# Altium schematic sheet Root.SchDoc
size A; SheetNumber: 1; SheetTotal: 8
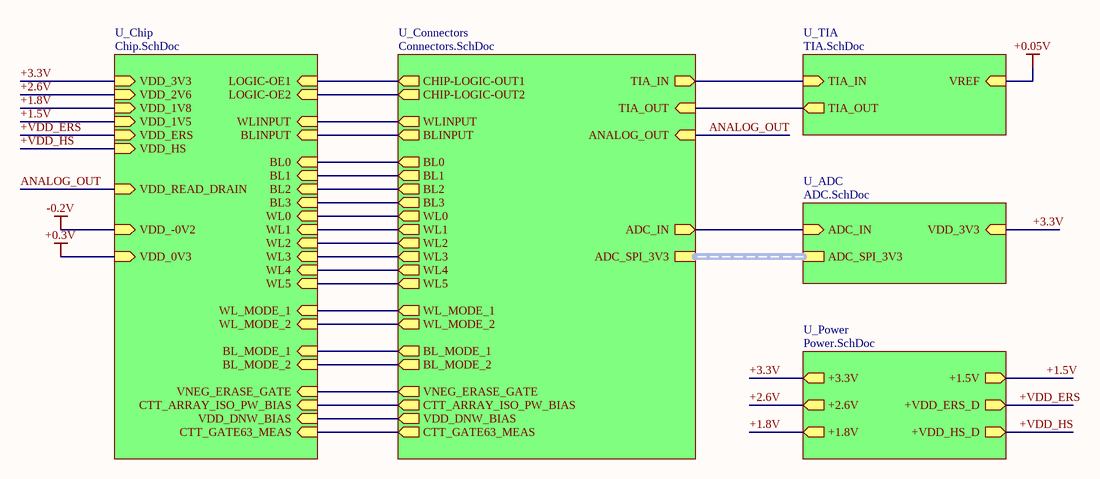
[diagram p0: Root.SchDoc]

## Sub-sheets
U_ADC = ADC.SchDoc: ADC_IN (in), VDD_3V3 (in), ADC_SPI_3V3 (harness ADC_SPI_3V3)
U_Chip = Chip.SchDoc: BL0 (in), BL1 (in), BL2 (in), BL3 (in), WL0 (in), WL1 (in), WL2 (in), WL3 (in), WL4 (in), WL5 (in), BL_MODE_2 (in), BL_MODE_1 (in), WL_MODE_2 (in), WL_MODE_1 (in), WLINPUT (in), BLINPUT (in), LOGIC-OE1 (in), LOGIC-OE2 (in), VDD_HS (in), VDD_ERS (in), VDD_1V5 (in), VDD_1V8 (in), VDD_2V6 (in), VDD_3V3 (in), VNEG_ERASE_GATE (in), CTT_ARRAY_ISO_PW_BIAS (in), CTT_GATE63_MEAS (in), VDD_DNW_BIAS (in), VDD_READ_DRAIN (in), VDD_-0V2 (in), VDD_0V3 (in)
U_Connectors = Connectors.SchDoc: BL0 (out), BL1 (out), WL0 (out), WL1 (out), WL2 (out), WL3 (out), WL4 (out), WL5 (out), BL2 (out), BL3 (out), BL_MODE_2 (out), BL_MODE_1 (out), WL_MODE_2 (out), WL_MODE_1 (out), TIA_IN (out), CHIP-LOGIC-OUT1 (out), CHIP-LOGIC-OUT2 (out), WLINPUT (out), BLINPUT (out), ADC_IN (out), TIA_OUT (in), ANALOG_OUT (in), VNEG_ERASE_GATE (out), CTT_ARRAY_ISO_PW_BIAS (out), CTT_GATE63_MEAS (out), VDD_DNW_BIAS (out), ADC_SPI_3V3 (harness ADC_SPI_3V3)
U_Power = Power.SchDoc: +1.5V (out), +1.8V (out), +2.6V (out), +3.3V (out), +VDD_ERS_D (out), +VDD_HS_D (out)
U_TIA = TIA.SchDoc: TIA_IN (in), VREF (in), TIA_OUT (out)

## Nets
+0.3V: sheet U_Chip/VDD_0V3
+0.05V: sheet U_TIA/VREF
-0.2V: sheet U_Chip/VDD_-0V2
+1.5V: sheet U_Power/+1.5V, sheet U_Chip/VDD_1V5
+1.8V: sheet U_Power/+1.8V, sheet U_Chip/VDD_1V8
+2.6V: sheet U_Power/+2.6V, sheet U_Chip/VDD_2V6
+3.3V: sheet U_ADC/VDD_3V3, sheet U_Power/+3.3V, sheet U_Chip/VDD_3V3
+VDD_ERS: sheet U_Power/+VDD_ERS_D, sheet U_Chip/VDD_ERS
+VDD_HS: sheet U_Power/+VDD_HS_D, sheet U_Chip/VDD_HS
ANALOG_OUT: sheet U_Connectors/ANALOG_OUT, sheet U_Chip/VDD_READ_DRAIN
(unnamed): sheet U_TIA/TIA_IN, sheet U_Connectors/TIA_IN
(unnamed): sheet U_TIA/TIA_OUT, sheet U_Connectors/TIA_OUT
(unnamed): sheet U_Connectors/BL0, sheet U_Chip/BL0
(unnamed): sheet U_Connectors/BL1, sheet U_Chip/BL1
(unnamed): sheet U_Connectors/WL0, sheet U_Chip/WL0
(unnamed): sheet U_Connectors/WL1, sheet U_Chip/WL1
(unnamed): sheet U_Connectors/WL2, sheet U_Chip/WL2
(unnamed): sheet U_Connectors/WL3, sheet U_Chip/WL3
(unnamed): sheet U_Connectors/WL4, sheet U_Chip/WL4
(unnamed): sheet U_Connectors/WL5, sheet U_Chip/WL5
(unnamed): sheet U_Connectors/BL2, sheet U_Chip/BL2
(unnamed): sheet U_Connectors/BL3, sheet U_Chip/BL3
(unnamed): sheet U_Connectors/BL_MODE_2, sheet U_Chip/BL_MODE_2
(unnamed): sheet U_Connectors/BL_MODE_1, sheet U_Chip/BL_MODE_1
(unnamed): sheet U_Connectors/WL_MODE_2, sheet U_Chip/WL_MODE_2
(unnamed): sheet U_Connectors/WL_MODE_1, sheet U_Chip/WL_MODE_1
(unnamed): sheet U_Connectors/CHIP-LOGIC-OUT1, sheet U_Chip/LOGIC-OE1
(unnamed): sheet U_Connectors/CHIP-LOGIC-OUT2, sheet U_Chip/LOGIC-OE2
(unnamed): sheet U_Connectors/WLINPUT, sheet U_Chip/WLINPUT
(unnamed): sheet U_Connectors/BLINPUT, sheet U_Chip/BLINPUT
(unnamed): sheet U_Connectors/ADC_IN, sheet U_ADC/ADC_IN
(unnamed): sheet U_Connectors/VNEG_ERASE_GATE, sheet U_Chip/VNEG_ERASE_GATE
(unnamed): sheet U_Connectors/CTT_ARRAY_ISO_PW_BIAS, sheet U_Chip/CTT_ARRAY_ISO_PW_BIAS
(unnamed): sheet U_Connectors/CTT_GATE63_MEAS, sheet U_Chip/CTT_GATE63_MEAS
(unnamed): sheet U_Connectors/VDD_DNW_BIAS, sheet U_Chip/VDD_DNW_BIAS

## Buses and harness runs
harness sheet U_ADC/ADC_SPI_3V3 = sheet U_Connectors/ADC_SPI_3V3